# Altium schematic sheet MCU.SchDoc: MCU, status LEDs, and I2C
size A3; SheetNumber: Sheet 2 of 3
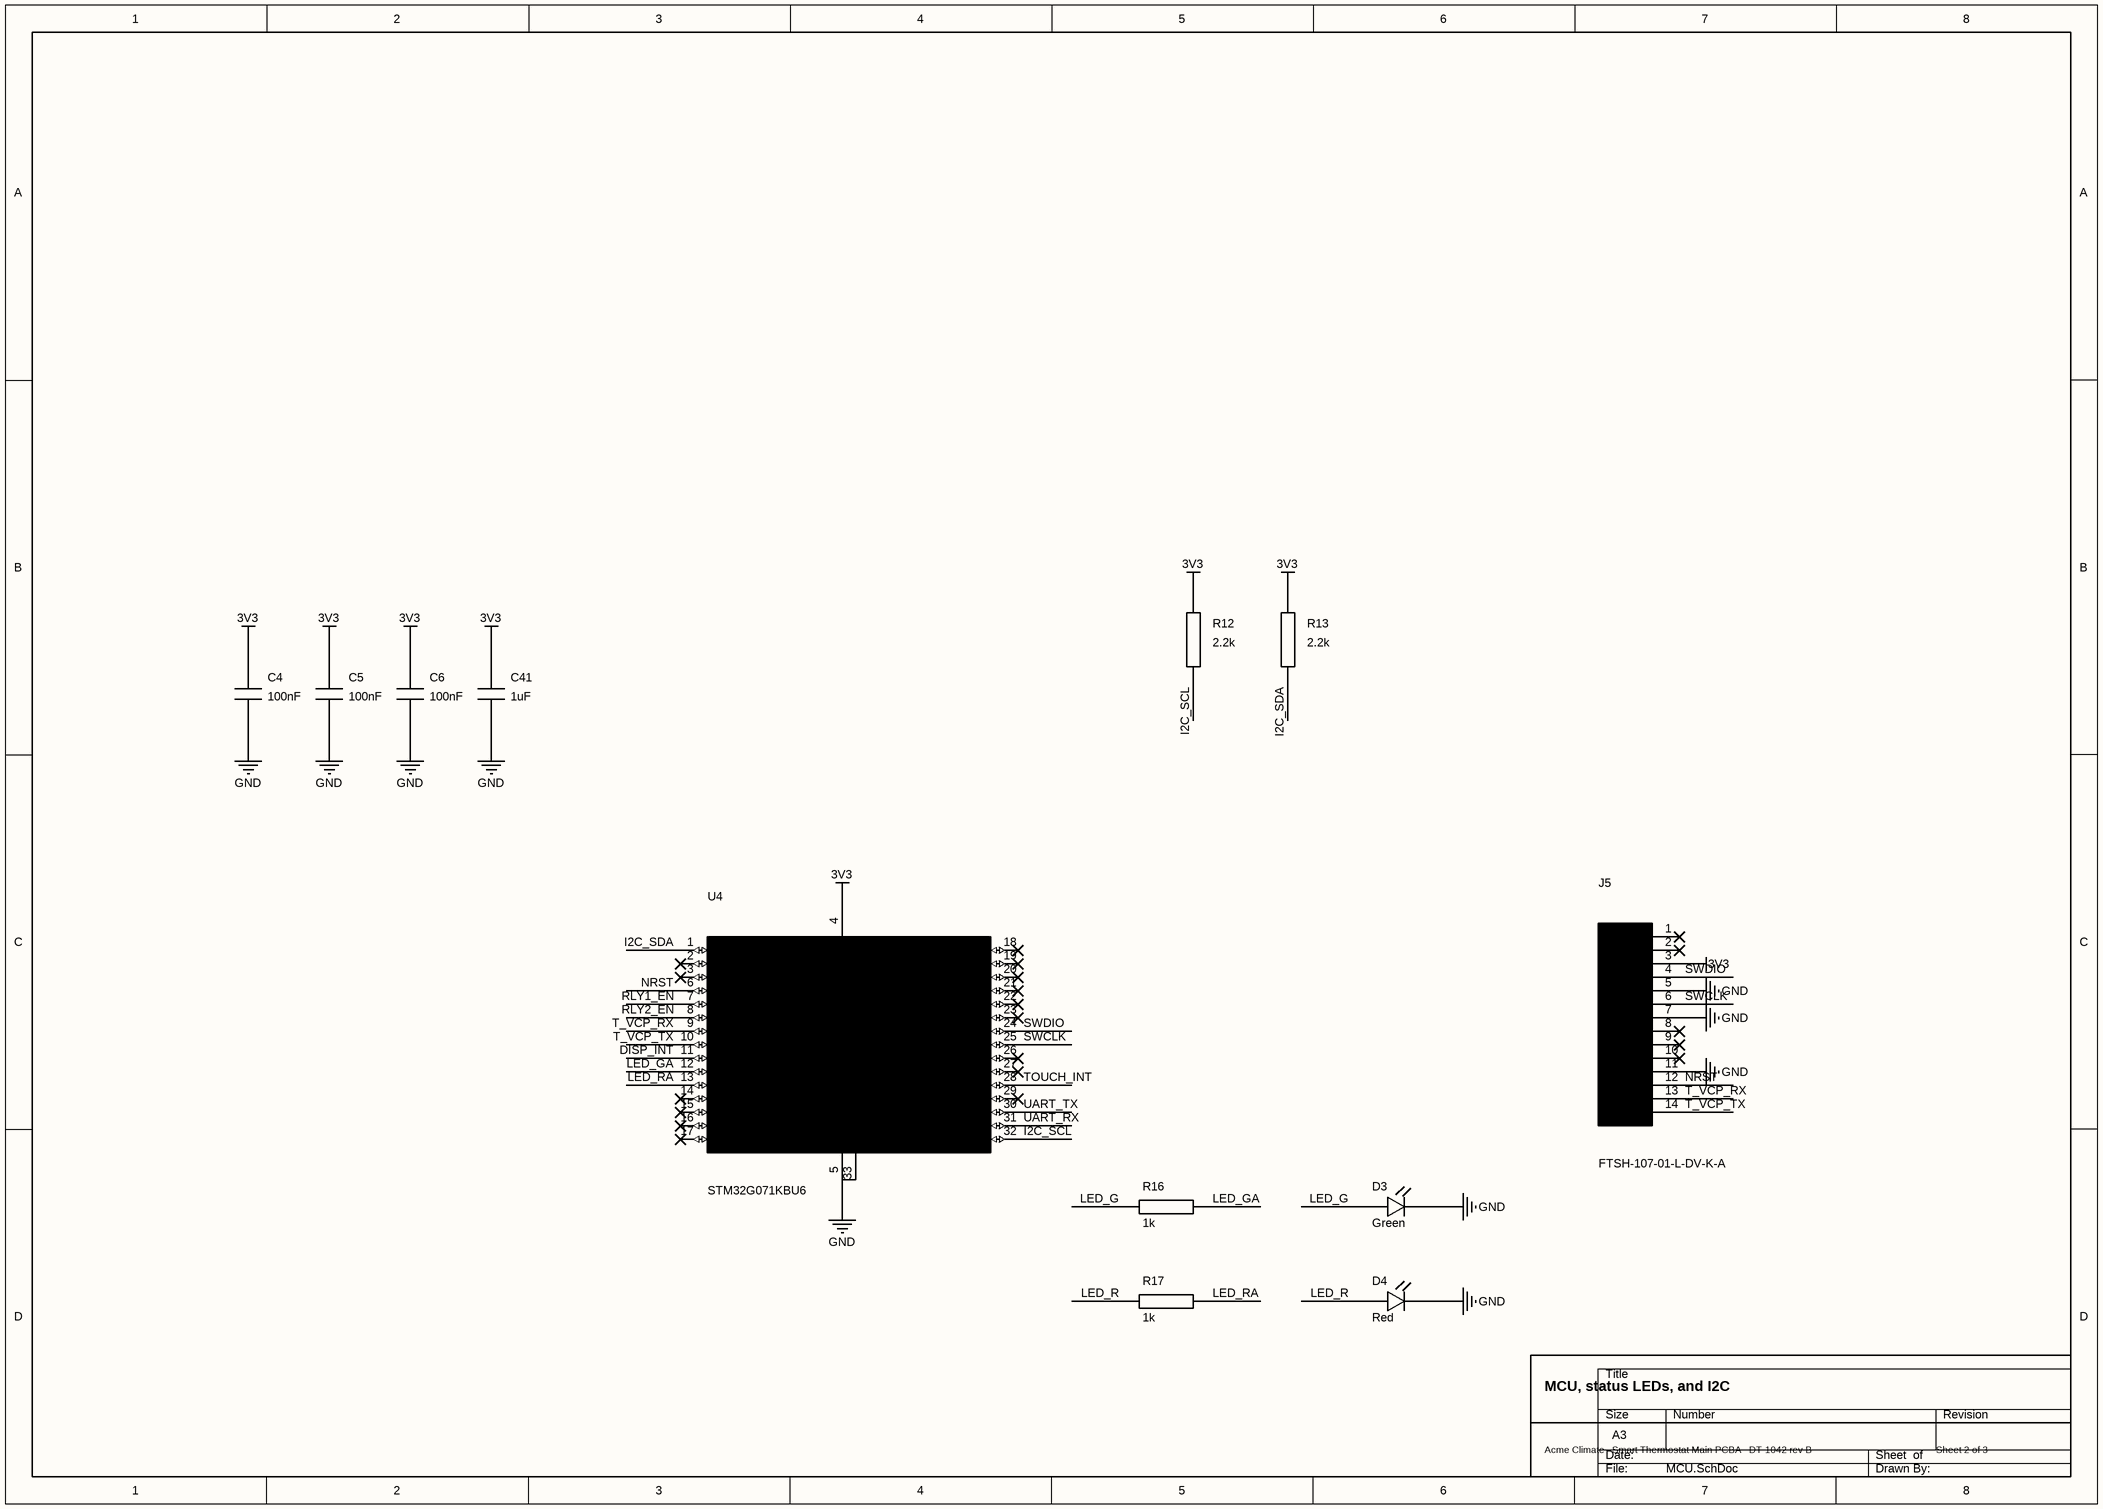
[diagram p0: MCU.SchDoc]

## Parts
C4  100nF
C5  100nF
C6  100nF
C41  1uF
D3  Green
D4  Red
J5  FTSH-107-01-L-DV-K-A
R12  2.2k
R13  2.2k
R16  1k
R17  1k
U4  STM32G071KBU6

## Nets
3V3: C4.1 C5.1 C6.1 C41.1 J5.3 R12.1 R13.1 U4.4(VDD/VDDA)
GND: C4.2 C5.2 C6.2 C41.2 D3.1(K) D4.1(K) J5.5 J5.7 J5.11 U4.5(VSS/VSSA) U4.33(VSS)
DISP_INT: U4.11(PA4)
I2C_SCL: R12.2 U4.32(PB8)
I2C_SDA: R13.2 U4.1(PB9)
LED_G: D3.2(A) R16.1
LED_GA: R16.2 U4.12(PA5)
LED_R: D4.2(A) R17.1
LED_RA: R17.2 U4.13(PA6)
NRST: J5.12 U4.6(PF2-NRST)
RLY1_EN: U4.7(PA0)
RLY2_EN: U4.8(PA1)
SWCLK: J5.6 U4.25(PA14-BOOT0)
SWDIO: J5.4 U4.24(PA13)
T_VCP_RX: J5.13 U4.9(PA2)
T_VCP_TX: J5.14 U4.10(PA3)
TOUCH_INT: U4.28(PB4)
UART_RX: U4.31(PB7)
UART_TX: U4.30(PB6)

Not connected (* = marked no-connect by the designer): J5 1* 2* 8* 9* 10*; U4 2(PC14-OSC32_IN)* 3(PC15-OSC32_OUT)* 14(PA7)* 15(PB0)* 16(PB1)* 17(PB2)* 18(PA8)* 19(PA9)* 20(PC6)* 21(PA10)* 22(PA11)* 23(PA12)* 26(PA15)* 27(PB3)* 29(PB5)*

## Notes on the sheet
- Acme Climate · Smart Thermostat Main PCBA · DT-1042 rev B

## Library data of the parts
C4-C6 = C: CAP CER 0.1UF 16V X7R 0402; Manufacturer Part Number: GRM155R71C104KA88D; Manufacturer: Murata
C41 = C: CAP CER 1UF 10V X5R 0402
D3 = LED: LED GREEN CLEAR 0603 SMD; Manufacturer Part Number: 150060GS75000; Manufacturer: Wurth Elektronik
D4 = LED: LED RED CLEAR 0603 SMD; Manufacturer Part Number: 150060RS75000; Manufacturer: Wurth Elektronik
J5 = Conn_02x07_Odd_Even: CONN HEADER SMD 14POS 1.27MM; Manufacturer: Samtec; Manufacturer Part Number: FTSH-107-01-L-DV-K-A
R12 R13 = R: RES SMD 2.2k 1% 1/16W 0402; Manufacturer Part Number: RC0402FR-072K2L; Manufacturer: Yageo
R16 R17 = R: RES SMD 1k 1% 1/16W 0402; Manufacturer Part Number: RC0402FR-071KL; Manufacturer: Yageo
U4 = STM32G071KBUx: IC MCU 32BIT 128KB FLASH 32UFQFPN; Manufacturer: STMicroelectronics; Manufacturer Part Number: STM32G071KBU6